# Altium schematic sheet 04 - FPGA_IO_MCU.SchDoc
size A3; SheetNumber: 3; SheetTotal: 7
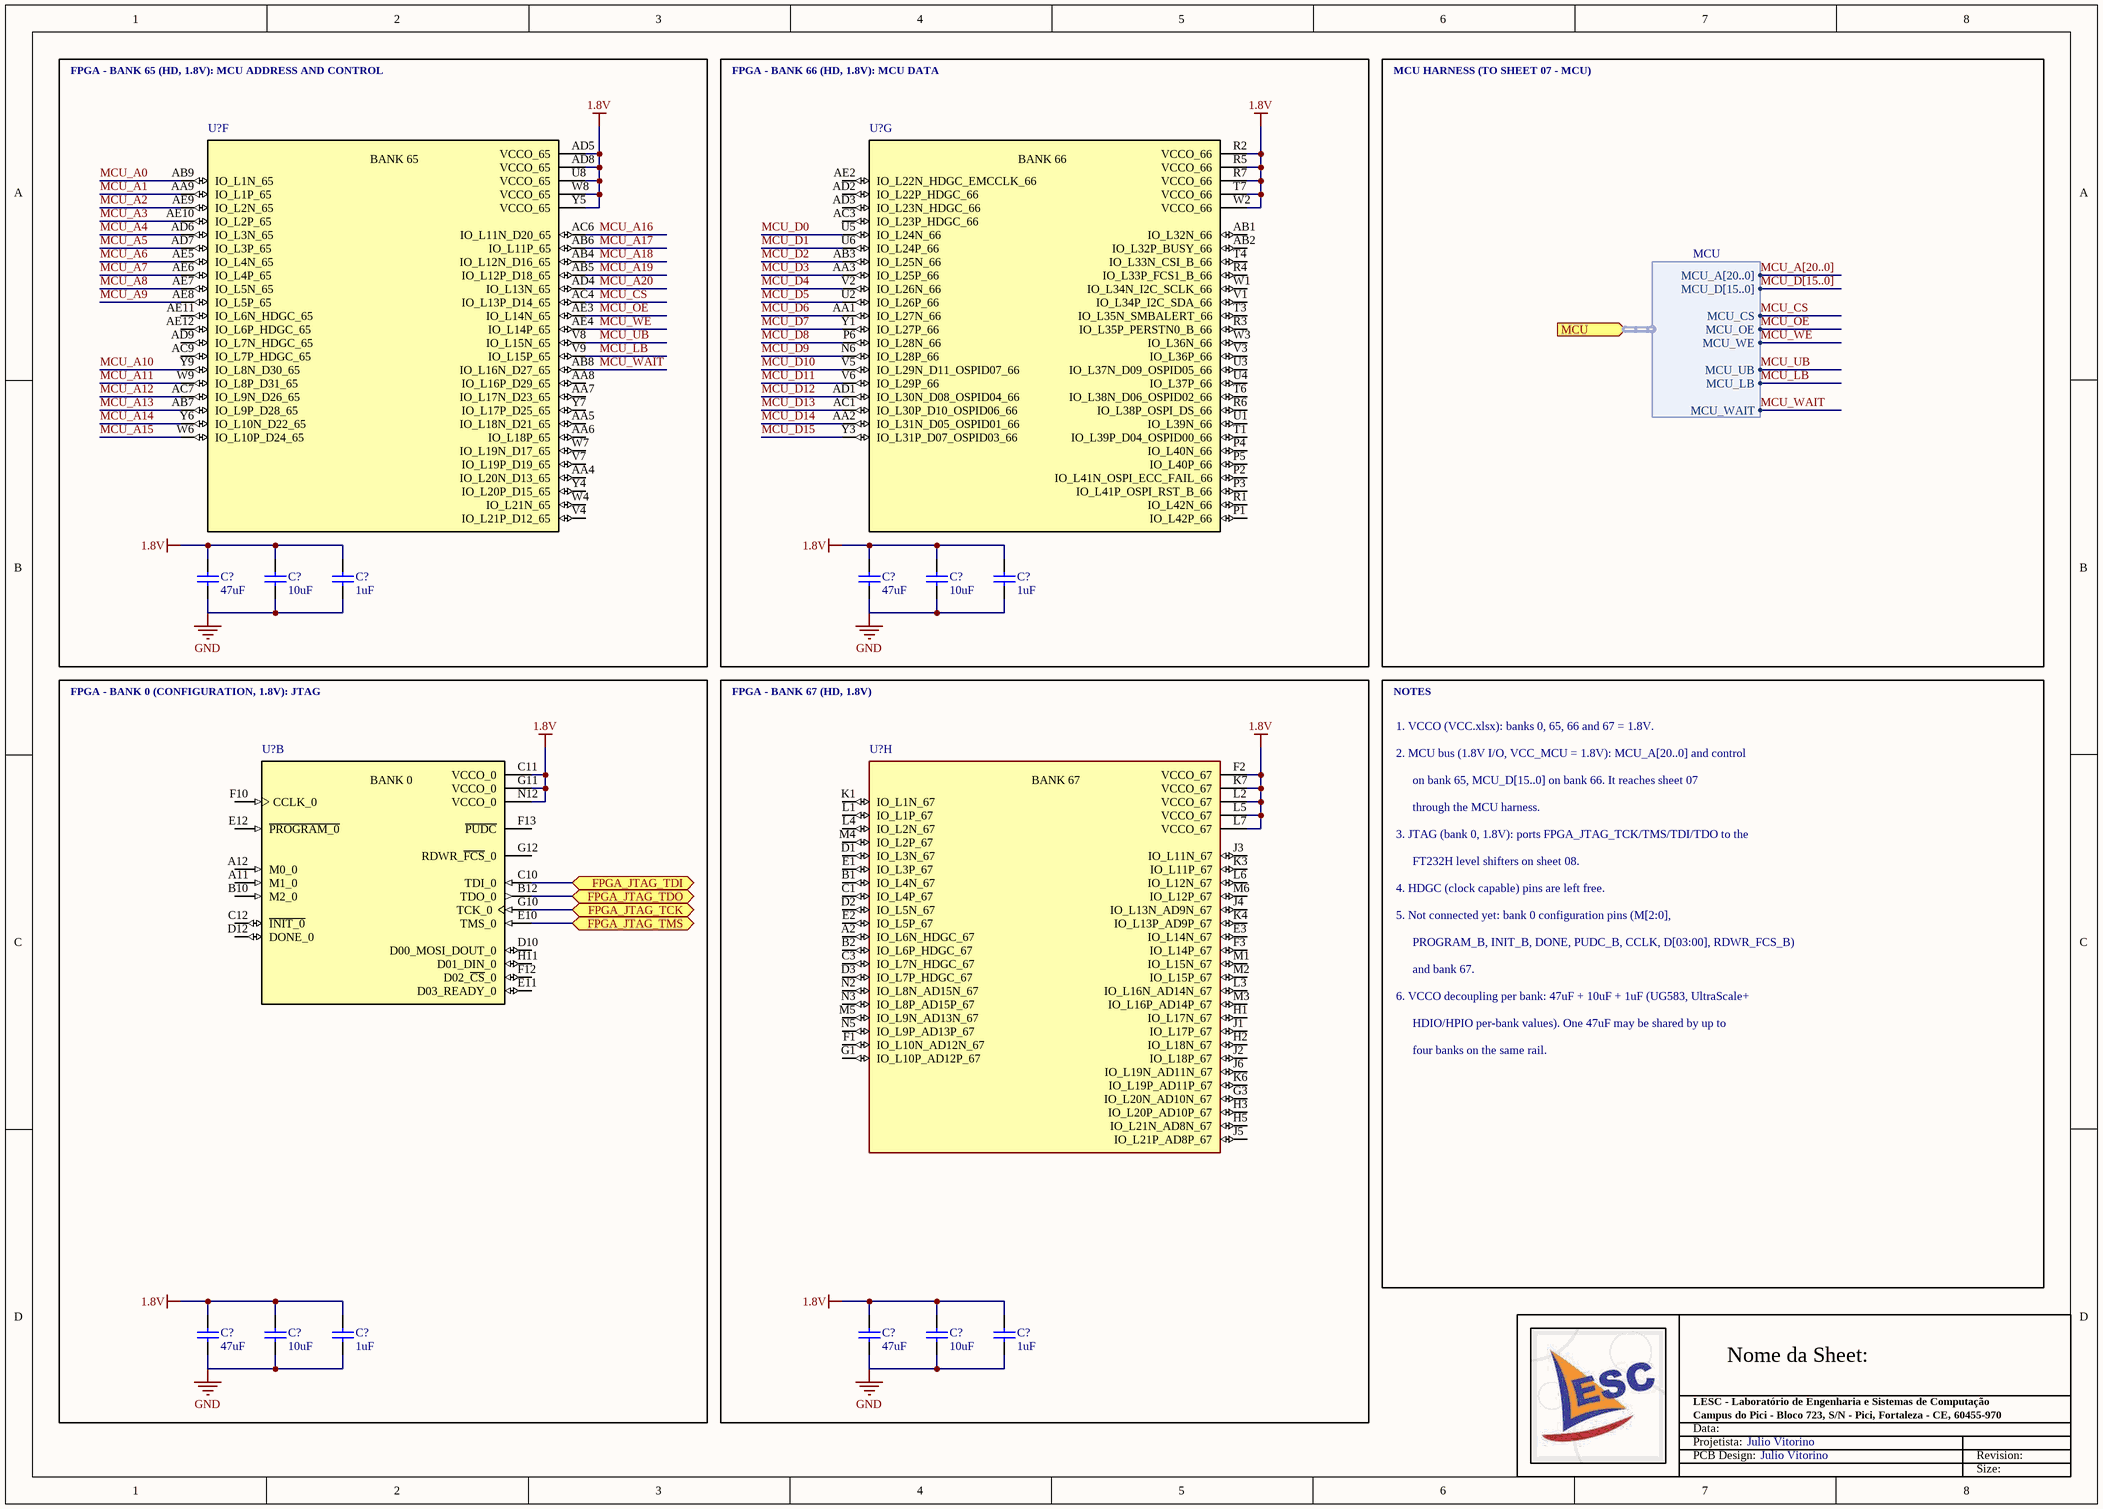
[diagram p0: 04 - FPGA_IO_MCU.SchDoc]

## Parts
(Parts that share a designator on the sheet are numbered #1, #2 ... from top to bottom, then left to right.)
C?#1  value 47uF  [0603-C-R]  (hidden comment: ZRB18AR60J476ME01L)
C?#2  CAPACITANCE: 10uF  [0402-C-R]  (hidden comment: CAP CER 10UF 6.3V X5R 0402)
C?#3  value 1uF  [0402-C-R]  (hidden comment: JMK105BJ105KV-F)
C?#4  value 47uF  [0603-C-R]  (hidden comment: ZRB18AR60J476ME01L)
C?#5  CAPACITANCE: 10uF  [0402-C-R]  (hidden comment: CAP CER 10UF 6.3V X5R 0402)
C?#6  value 1uF  [0402-C-R]  (hidden comment: JMK105BJ105KV-F)
C?#7  value 47uF  [0603-C-R]  (hidden comment: ZRB18AR60J476ME01L)
C?#8  CAPACITANCE: 10uF  [0402-C-R]  (hidden comment: CAP CER 10UF 6.3V X5R 0402)
C?#9  value 1uF  [0402-C-R]  (hidden comment: JMK105BJ105KV-F)
C?#10  value 47uF  [0603-C-R]  (hidden comment: ZRB18AR60J476ME01L)
C?#11  CAPACITANCE: 10uF  [0402-C-R]  (hidden comment: CAP CER 10UF 6.3V X5R 0402)
C?#12  value 1uF  [0402-C-R]  (hidden comment: JMK105BJ105KV-F)
U?#1  IC FPGA 304 I/O 625-BGA/FCBGA  [BGA625C80P25X25_2100X2100X192]  (value not drawn)  (part F of 11)
U?#2  IC FPGA 304 I/O 625-BGA/FCBGA  [BGA625C80P25X25_2100X2100X192]  (value not drawn)  (part G of 11)
U?#3  IC FPGA 304 I/O 625-BGA/FCBGA  [BGA625C80P25X25_2100X2100X192]  (value not drawn)  (part B of 11)
U?#4  IC FPGA 304 I/O 625-BGA/FCBGA  [BGA625C80P25X25_2100X2100X192]  (value not drawn)  (part H of 11)

## Blocks framed on the sheet
FPGA - BANK 65 (HD, 1.8V): MCU ADDRESS AND CONTROL: C?#1-C?#3 U?#1
FPGA - BANK 66 (HD, 1.8V): MCU DATA: C?#4-C?#6 U?#2
FPGA - BANK 0 (CONFIGURATION, 1.8V): JTAG: C?#7-C?#9 U?#3
FPGA - BANK 67 (HD, 1.8V): C?#10-C?#12 U?#4

## Ports
FPGA_JTAG_TCK (bidir), FPGA_JTAG_TDI (bidir), FPGA_JTAG_TDO (bidir), FPGA_JTAG_TMS (bidir), MCU (in, harness MCU)

## Harnesses
MCU: MCU_A[20..0], MCU_D[15..0], MCU_OE, MCU_WE, MCU_CS, MCU_UB, MCU_LB, MCU_WAIT

## Nets
1.8V: C?#1.2 C?#2.2 C?#3.2 C?#4.2 C?#5.2 C?#6.2 C?#7.2 C?#8.2 C?#9.2 C?#10.2 C?#11.2 C?#12.2 U?#1.AD5(VCCO_65) U?#1.AD8(VCCO_65) U?#1.U8(VCCO_65) U?#1.W8(VCCO_65) U?#1.Y5(VCCO_65) U?#2.R2(VCCO_66) U?#2.R5(VCCO_66) U?#2.R7(VCCO_66) U?#2.T7(VCCO_66) U?#2.W2(VCCO_66) U?#3.C11(VCCO_0) U?#3.G11(VCCO_0) U?#3.N12(VCCO_0) U?#4.F2(VCCO_67) U?#4.K7(VCCO_67) U?#4.L2(VCCO_67) U?#4.L5(VCCO_67) U?#4.L7(VCCO_67)
GND: C?#1.1 C?#2.1 C?#3.1 C?#4.1 C?#5.1 C?#6.1 C?#7.1 C?#8.1 C?#9.1 C?#10.1 C?#11.1 C?#12.1
FPGA_JTAG_TCK: U?#3.G10(TCK_0) ; port FPGA_JTAG_TCK
FPGA_JTAG_TDI: U?#3.C10(TDI_0) ; port FPGA_JTAG_TDI
FPGA_JTAG_TDO: U?#3.B12(TDO_0) ; port FPGA_JTAG_TDO
FPGA_JTAG_TMS: U?#3.E10(TMS_0) ; port FPGA_JTAG_TMS
MCU_A0: U?#1.AB9(IO_L1N_65)
MCU_A1: U?#1.AA9(IO_L1P_65)
MCU_A2: U?#1.AE9(IO_L2N_65)
MCU_A3: U?#1.AE10(IO_L2P_65)
MCU_A4: U?#1.AD6(IO_L3N_65)
MCU_A5: U?#1.AD7(IO_L3P_65)
MCU_A6: U?#1.AE5(IO_L4N_65)
MCU_A7: U?#1.AE6(IO_L4P_65)
MCU_A8: U?#1.AE7(IO_L5N_65)
MCU_A9: U?#1.AE8(IO_L5P_65)
MCU_A10: U?#1.Y9(IO_L8N_D30_65)
MCU_A11: U?#1.W9(IO_L8P_D31_65)
MCU_A12: U?#1.AC7(IO_L9N_D26_65)
MCU_A13: U?#1.AB7(IO_L9P_D28_65)
MCU_A14: U?#1.Y6(IO_L10N_D22_65)
MCU_A15: U?#1.W6(IO_L10P_D24_65)
MCU_A16: U?#1.AC6(IO_L11N_D20_65)
MCU_A17: U?#1.AB6(IO_L11P_65)
MCU_A18: U?#1.AB4(IO_L12N_D16_65)
MCU_A19: U?#1.AB5(IO_L12P_D18_65)
MCU_A20: U?#1.AD4(IO_L13N_65)
MCU_CS: U?#1.AC4(IO_L13P_D14_65) ; port MCU.MCU_CS
MCU_D0: U?#2.U5(IO_L24N_66)
MCU_D1: U?#2.U6(IO_L24P_66)
MCU_D2: U?#2.AB3(IO_L25N_66)
MCU_D3: U?#2.AA3(IO_L25P_66)
MCU_D4: U?#2.V2(IO_L26N_66)
MCU_D5: U?#2.U2(IO_L26P_66)
MCU_D6: U?#2.AA1(IO_L27N_66)
MCU_D7: U?#2.Y1(IO_L27P_66)
MCU_D8: U?#2.P6(IO_L28N_66)
MCU_D9: U?#2.N6(IO_L28P_66)
MCU_D10: U?#2.V5(IO_L29N_D11_OSPID07_66)
MCU_D11: U?#2.V6(IO_L29P_66)
MCU_D12: U?#2.AD1(IO_L30N_D08_OSPID04_66)
MCU_D13: U?#2.AC1(IO_L30P_D10_OSPID06_66)
MCU_D14: U?#2.AA2(IO_L31N_D05_OSPID01_66)
MCU_D15: U?#2.Y3(IO_L31P_D07_OSPID03_66)
MCU_LB: U?#1.V9(IO_L15P_65) ; port MCU.MCU_LB
MCU_OE: U?#1.AE3(IO_L14N_65) ; port MCU.MCU_OE
MCU_UB: U?#1.V8(IO_L15N_65) ; port MCU.MCU_UB
MCU_WAIT: U?#1.AB8(IO_L16N_D27_65) ; port MCU.MCU_WAIT
MCU_WE: U?#1.AE4(IO_L14P_65) ; port MCU.MCU_WE

Not connected (* = marked no-connect by the designer): U?#1 AA4(IO_L20N_D13_65) AA5(IO_L18N_D21_65) AA6(IO_L18P_65) AA7(IO_L17N_D23_65) AA8(IO_L16P_D29_65) AC9(IO_L7P_HDGC_65) AD9(IO_L7N_HDGC_65) AE11(IO_L6N_HDGC_65) AE12(IO_L6P_HDGC_65) V4(IO_L21P_D12_65) V7(IO_L19P_D19_65) W4(IO_L21N_65) W7(IO_L19N_D17_65) Y4(IO_L20P_D15_65) Y7(IO_L17P_D25_65); U?#2 AB1(IO_L32N_66) AB2(IO_L32P_BUSY_66) AC3(IO_L23P_HDGC_66) AD2(IO_L22P_HDGC_66) AD3(IO_L23N_HDGC_66) AE2(IO_L22N_HDGC_EMCCLK_66) P1(IO_L42P_66) P2(IO_L41N_OSPI_ECC_FAIL_66) P3(IO_L41P_OSPI_RST_B_66) P4(IO_L40N_66) P5(IO_L40P_66) R1(IO_L42N_66) R3(IO_L35P_PERSTN0_B_66) R4(IO_L33P_FCS1_B_66) R6(IO_L38P_OSPI_DS_66) T1(IO_L39P_D04_OSPID00_66) T3(IO_L35N_SMBALERT_66) T4(IO_L33N_CSI_B_66) T6(IO_L38N_D06_OSPID02_66) U1(IO_L39N_66) U3(IO_L37N_D09_OSPID05_66) U4(IO_L37P_66) V1(IO_L34P_I2C_SDA_66) V3(IO_L36P_66) W1(IO_L34N_I2C_SCLK_66) W3(IO_L36N_66); U?#3 A11(M1_0) A12(M0_0) B10(M2_0) C12(~{INIT_0}) D10(D00_MOSI_DOUT_0) D12(DONE_0) E11(D03_READY_0) E12(~{PROGRAM_0}) F10(CCLK_0) F12(D02_~{CS}_0) F13(~{PUDC}) G12(RDWR_~{FCS}_0) H11(D01_DIN_0); U?#4 A2(IO_L6N_HDGC_67) B1(IO_L4N_67) B2(IO_L6P_HDGC_67) C1(IO_L4P_67) C3(IO_L7N_HDGC_67) D1(IO_L3N_67) D2(IO_L5N_67) D3(IO_L7P_HDGC_67) E1(IO_L3P_67) E2(IO_L5P_67) E3(IO_L14N_67) F1(IO_L10N_AD12N_67) F3(IO_L14P_67) G1(IO_L10P_AD12P_67) G3(IO_L20N_AD10N_67) H1(IO_L17N_67) H2(IO_L18N_67) H3(IO_L20P_AD10P_67) H5(IO_L21N_AD8N_67) J1(IO_L17P_67) J2(IO_L18P_67) J3(IO_L11N_67) J4(IO_L13N_AD9N_67) J5(IO_L21P_AD8P_67) J6(IO_L19N_AD11N_67) K1(IO_L1N_67) K3(IO_L11P_67) K4(IO_L13P_AD9P_67) K6(IO_L19P_AD11P_67) L1(IO_L1P_67) L3(IO_L16N_AD14N_67) L4(IO_L2N_67) L6(IO_L12N_67) M1(IO_L15N_67) M2(IO_L15P_67) M3(IO_L16P_AD14P_67) M4(IO_L2P_67) M5(IO_L9N_AD13N_67) M6(IO_L12P_67) N2(IO_L8N_AD15N_67) N3(IO_L8P_AD15P_67) N5(IO_L9P_AD13P_67)

## Buses and harness runs
bus MCU_A[20..0]
bus MCU_D[15..0]

## Notes on the sheet
- MCU HARNESS (TO SHEET 07 - MCU)
- NOTES
- 1. VCCO (VCC.xlsx): banks 0, 65, 66 and 67 = 1.8V.
- 2. MCU bus (1.8V I/O, VCC_MCU = 1.8V): MCU_A[20..0] and control
- on bank 65, MCU_D[15..0] on bank 66. It reaches sheet 07
- 3. JTAG (bank 0, 1.8V): ports FPGA_JTAG_TCK/TMS/TDI/TDO to the
- through the MCU harness.
- 4. HDGC (clock capable) pins are left free.
- 5. Not connected yet: bank 0 configuration pins (M[2:0],
- FT232H level shifters on sheet 08.
- PROGRAM_B, INIT_B, DONE, PUDC_B, CCLK, D[03:00], RDWR_FCS_B)
- and bank 67.
- 6. VCCO decoupling per bank: 47uF + 10uF + 1uF (UG583, UltraScale+
- HDIO/HPIO per-bank values). One 47uF may be shared by up to
- four banks on the same rail.
- Nome da Sheet:
- Data:
- Projetista:
- PCB Design:
- LESC - Laboratório de Engenharia e Sistemas de Computação
- Campus do Pici - Bloco 723, S/N - Pici, Fortaleza - CE, 60455-970
- Julio Vitorino
- Revision:
- Size:
- (in symbol IC FPGA 304 I/O 625-BGA/FCBGA, part B) BANK 0
- (in symbol IC FPGA 304 I/O 625-BGA/FCBGA, part F) BANK 65
- (in symbol IC FPGA 304 I/O 625-BGA/FCBGA, part G) BANK 66
- (in symbol IC FPGA 304 I/O 625-BGA/FCBGA, part H) BANK 67

## Library data of the parts
C?#1 C?#4 C?#7 C?#10 = CAP CER 47UF 6.3V X5R 0603: 47 µF ±20% 6.3V Ceramic Capacitor X5R 0603 (1608 Metric); SIZE: 0603; PN: ZRB18AR60J476ME01L; VOLTAGE: 6.3V; TOLERANCE: 20%
C?#2 C?#5 C?#8 C?#11 = CAP CER 10UF 6.3V X5R 0402: 10 µF ±20% 6.3V Ceramic Capacitor X5R 0402 (1005 Metric) / PN: GRM155R60J106ME05D; Mfr_Name: Murata; Type: Ceramic Capacitors; PN: GRM155R60J106ME05D
C?#3 C?#6 C?#9 C?#12 = CAP CER 1UF 6.3V X5R 0402: 1 µF ±10% 6.3V Ceramic Capacitor X5R 0402 (1005 Metric); SIZE: 0402; VOLTAGE: 6.3V; TOLERANCE: 10%; PN: JMK105BJ105KV-F
U?#1-U?#4 = IC FPGA 304 I/O 625-BGA/FCBGA: IC FPGA 304 I/O 625-BGA/FCBGA PN: XCSU35P-1SBVB625I; MF: AMD; Package: None; Price: None; Value: *; SnapEDA_Link: https://www.snapeda.com/parts/XCSU10P-2SBVB625I/AMD/view-part/?ref=snap; PN: XCSU35P-1SBVB625I; Availability: Unavailable; Check_prices: https://www.snapeda.com/parts/XCSU10P-2SBVB625I/AMD/view-part/?ref=eda